# Altium schematic sheet I2C_Mux_Section.SchDoc
size A4; SheetNumber: 5
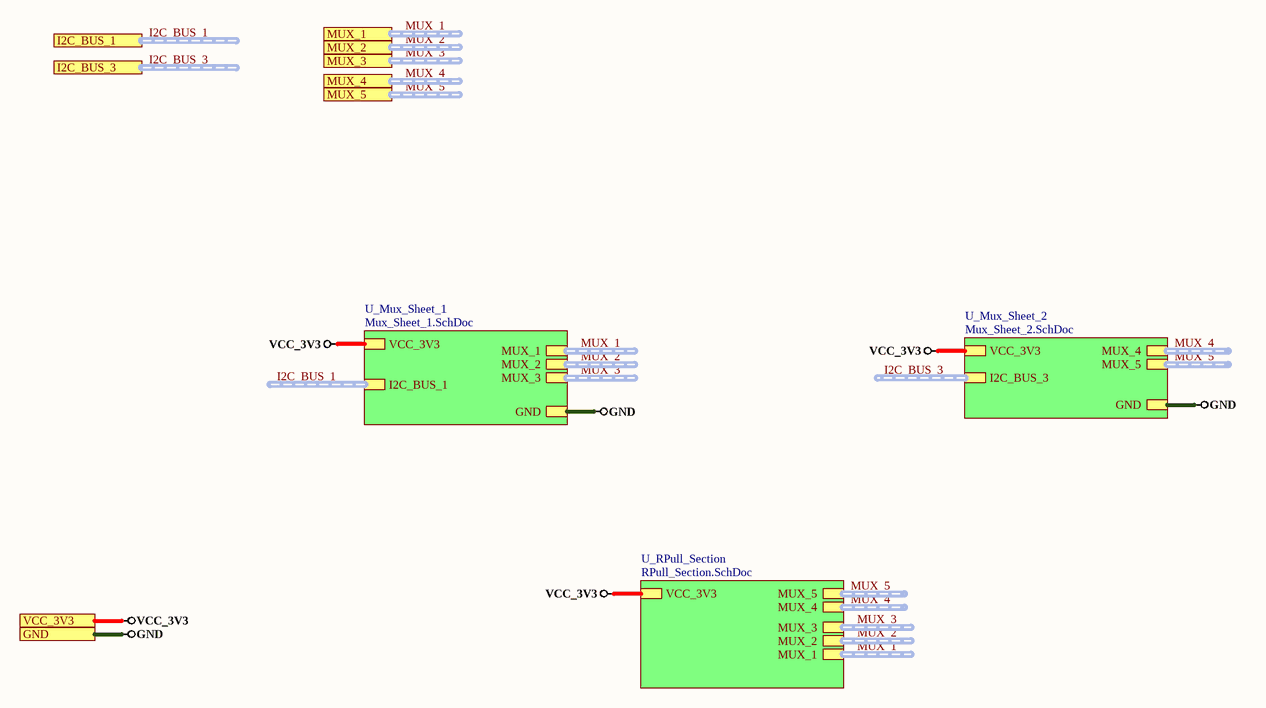
[diagram p0: I2C_Mux_Section.SchDoc]

## Sub-sheets
U_Mux_Sheet_1 = Mux_Sheet_1.SchDoc: I2C_BUS_1 (harness I2C_BUS_1), VCC_3V3, GND, MUX_1 (harness MUX_1), MUX_2 (harness MUX_2), MUX_3 (harness MUX_3)
U_Mux_Sheet_2 = Mux_Sheet_2.SchDoc: VCC_3V3, GND, MUX_4 (harness MUX_4), MUX_5 (harness MUX_5), I2C_BUS_3 (harness I2C_BUS_3)
U_RPull_Section = RPull_Section.SchDoc: MUX_4 (harness MUX_4), MUX_5 (harness MUX_5), MUX_1 (harness MUX_1), MUX_2 (harness MUX_2), MUX_3 (harness MUX_3), VCC_3V3

## Ports
GND, I2C_BUS_1 (harness I2C_BUS_1), I2C_BUS_3 (harness I2C_BUS_3), MUX_1 (harness MUX_1), MUX_2 (harness MUX_2), MUX_3 (harness MUX_3), MUX_4 (harness MUX_4), MUX_5 (harness MUX_5), VCC_3V3

## Nets
GND: port GND, sheet U_Mux_Sheet_1/GND, sheet U_Mux_Sheet_2/GND
VCC_3V3: port VCC_3V3, sheet U_Mux_Sheet_1/VCC_3V3, sheet U_Mux_Sheet_2/VCC_3V3, sheet U_RPull_Section/VCC_3V3

## Buses and harness runs
harness I2C_BUS_1 = port I2C_BUS_1
harness I2C_BUS_1 = sheet U_Mux_Sheet_1/I2C_BUS_1
harness I2C_BUS_3 = port I2C_BUS_3
harness I2C_BUS_3 = sheet U_Mux_Sheet_2/I2C_BUS_3
harness MUX_1 = port MUX_1
harness MUX_1 = sheet U_Mux_Sheet_1/MUX_1
harness MUX_1 = sheet U_RPull_Section/MUX_1
harness MUX_2 = port MUX_2
harness MUX_2 = sheet U_Mux_Sheet_1/MUX_2
harness MUX_2 = sheet U_RPull_Section/MUX_2
harness MUX_3 = port MUX_3
harness MUX_3 = sheet U_Mux_Sheet_1/MUX_3
harness MUX_3 = sheet U_RPull_Section/MUX_3
harness MUX_4 = port MUX_4
harness MUX_4 = sheet U_Mux_Sheet_2/MUX_4
harness MUX_4 = sheet U_RPull_Section/MUX_4
harness MUX_5 = port MUX_5
harness MUX_5 = sheet U_Mux_Sheet_2/MUX_5
harness MUX_5 = sheet U_RPull_Section/MUX_5